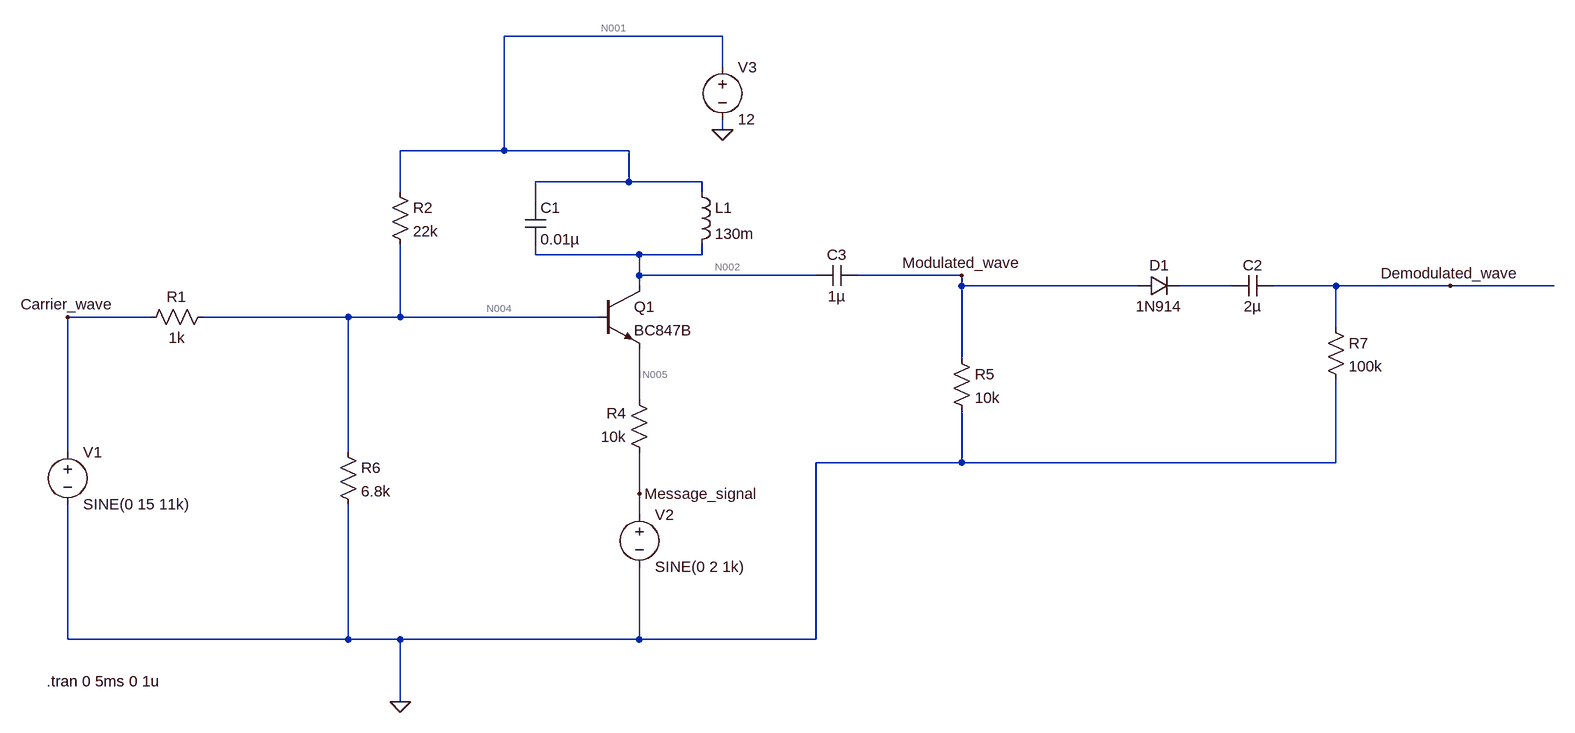
[diagram p0: schematic Amplitude Modulation and demodulation.asc]
Amplitude Modulation and demodulation.asc, the LTspice schematic file:
Version 4
SHEET 1 1984 860
WIRE 688 -240 352 -240
WIRE 688 -192 688 -240
WIRE 688 -96 688 -112
WIRE 352 -64 352 -240
WIRE 352 -64 192 -64
WIRE 544 -64 352 -64
WIRE 544 -16 544 -64
WIRE 544 -16 400 -16
WIRE 656 -16 544 -16
WIRE 192 0 192 -64
WIRE 656 0 656 -16
WIRE 400 16 400 -16
WIRE 400 96 400 80
WIRE 560 96 400 96
WIRE 656 96 656 80
WIRE 656 96 560 96
WIRE 560 128 560 96
WIRE 832 128 560 128
WIRE 1056 128 896 128
WIRE 560 144 560 128
WIRE 1056 144 1056 128
WIRE 1328 144 1056 144
WIRE 1472 144 1392 144
WIRE 1632 144 1536 144
WIRE 1808 144 1632 144
WIRE 1968 144 1808 144
WIRE -192 192 -320 192
WIRE 112 192 -112 192
WIRE 192 192 192 80
WIRE 192 192 112 192
WIRE 496 192 192 192
WIRE 1632 208 1632 144
WIRE 1056 256 1056 144
WIRE 560 320 560 240
WIRE -320 400 -320 192
WIRE 112 400 112 192
WIRE 1056 416 1056 336
WIRE 1056 416 832 416
WIRE 1632 416 1632 288
WIRE 1632 416 1056 416
WIRE 560 464 560 400
WIRE 560 496 560 464
WIRE -320 688 -320 480
WIRE 112 688 112 480
WIRE 112 688 -320 688
WIRE 192 688 112 688
WIRE 560 688 560 576
WIRE 560 688 192 688
WIRE 832 688 832 416
WIRE 832 688 560 688
WIRE 192 784 192 688
FLAG 688 -96 0
FLAG 192 784 0
FLAG -320 192 Carrier_wave
FLAG 1056 128 Modulated_wave
FLAG 1808 144 Demodulated_wave
FLAG 560 464 Message_signal
SYMBOL voltage -320 384 R0
WINDOW 123 0 0 Left 0
WINDOW 39 0 0 Left 0
SYMATTR InstName V1
SYMATTR Value SINE(0 15 11k)
SYMBOL voltage 560 480 R0
WINDOW 123 0 0 Left 0
WINDOW 39 0 0 Left 0
SYMATTR InstName V2
SYMATTR Value SINE(0 2 1k)
SYMBOL res -96 176 R90
WINDOW 0 0 56 VBottom 2
WINDOW 3 32 56 VTop 2
SYMATTR InstName R1
SYMATTR Value 1k
SYMBOL res 576 416 R180
WINDOW 0 36 76 Left 2
WINDOW 3 36 40 Left 2
SYMATTR InstName R4
SYMATTR Value 10k
SYMBOL cap 384 16 R0
SYMATTR InstName C1
SYMATTR Value 0.01µ
SYMBOL ind 640 -16 R0
SYMATTR InstName L1
SYMATTR Value 130m
SYMBOL res 176 -16 R0
SYMATTR InstName R2
SYMATTR Value 22k
SYMBOL voltage 688 -208 R0
SYMATTR InstName V3
SYMATTR Value 12
SYMBOL cap 896 112 R90
WINDOW 0 0 32 VBottom 2
WINDOW 3 32 32 VTop 2
SYMATTR InstName C3
SYMATTR Value 1µ
SYMBOL res 1040 240 R0
SYMATTR InstName R5
SYMATTR Value 10k
SYMBOL res 96 384 R0
SYMATTR InstName R6
SYMATTR Value 6.8k
SYMBOL diode 1328 160 R270
WINDOW 0 32 32 VTop 2
WINDOW 3 0 32 VBottom 2
SYMATTR InstName D1
SYMATTR Value 1N914
SYMBOL res 1616 192 R0
SYMATTR InstName R7
SYMATTR Value 100k
SYMBOL npn 496 144 R0
SYMATTR InstName Q1
SYMATTR Value BC847B
SYMBOL cap 1536 128 R90
WINDOW 0 0 32 VBottom 2
WINDOW 3 32 32 VTop 2
SYMATTR InstName C2
SYMATTR Value 2µ
TEXT -352 752 Left 2 !.tran 0 5ms 0 1u

The netlist it stands for:
* Amplitude Modulation and demodulation.asc
V1 Carrier_wave 0 SINE(0 15 11k)
V2 Message_signal 0 SINE(0 2 1k)
R1 N004 Carrier_wave 1k
R4 Message_signal N005 10k
C1 N001 N002 0.01µ
L1 N001 N002 130m
R2 N001 N004 22k
V3 N001 0 12
C3 Modulated_wave N002 1µ
R5 Modulated_wave 0 10k
R6 N004 0 6.8k
D1 Modulated_wave N003 1N914
R7 Demodulated_wave 0 100k
Q1 N002 N004 N005 0 BC847B
C2 Demodulated_wave N003 2µ
.model D D
.lib standard.dio
.model NPN NPN
.model PNP PNP
.lib standard.bjt
.tran 0 5ms 0 1u
.backanno
.end

* Results of the author's LTspice run, read from the files saved beside the schematic
* Operating Point, zero values left out:
*   V(n004) = 457.4 mV
*   V(n005) = 8.051 mV
*   V(n001) = 12 V
*   V(n002) = 12 V
*   Ic(Q1) = 802.9 nA
*   Ib(Q1) = 2.268 nA
*   Ie(Q1) = -805.1 nA
*   I(L1) = 802.9 nA
*   I(R1) = 457.4 µA
*   I(R4) = -805.1 nA
*   I(R2) = 524.7 µA
*   I(R6) = 67.26 µA
*   I(V1) = 457.4 µA
*   I(V2) = 805.1 nA
*   I(V3) = -525.5 µA